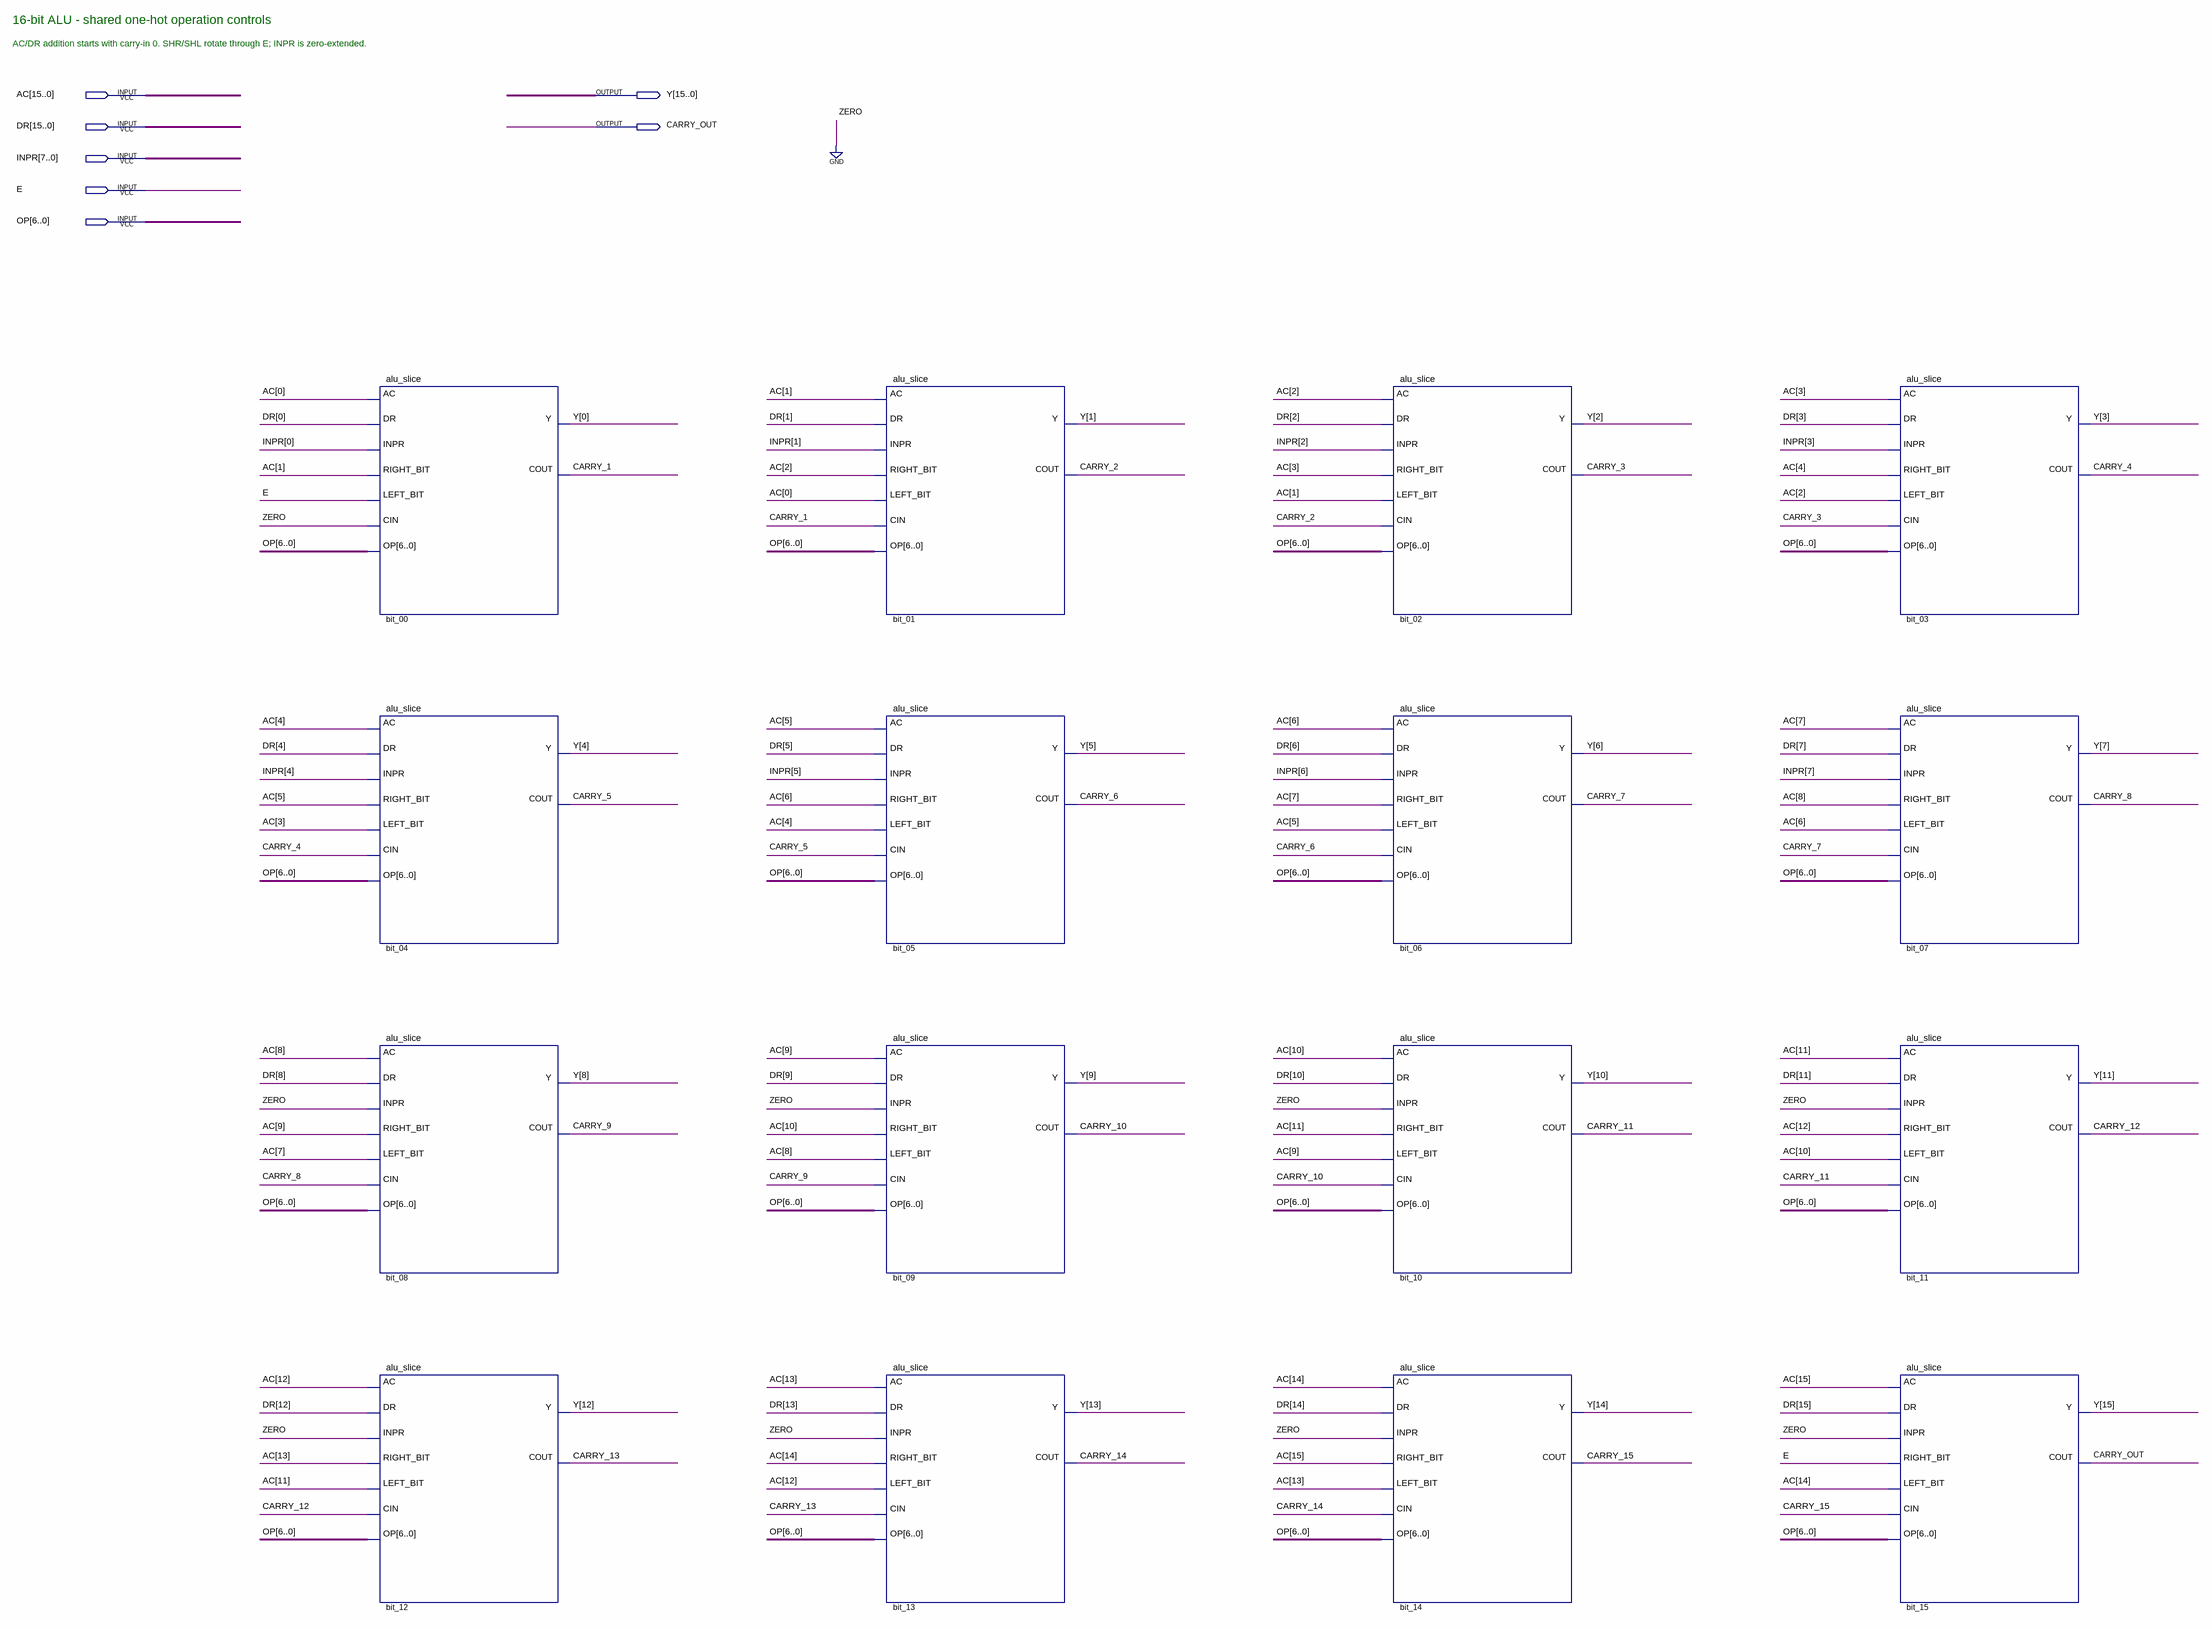
[diagram p0: schematic sheet]
// Quartus schematic alu16.bdf as structural Verilog: 16 symbols, 7 pins
module alu16 (
  input  [15:0] AC,
  input  [15:0] DR,
  input  [7:0] INPR,
  input  E,
  input  [6:0] OP,
  output [15:0] Y,
  output CARRY_OUT
);

  wire CARRY_1, CARRY_2, CARRY_3, CARRY_4, CARRY_5, CARRY_6, CARRY_7, CARRY_8, CARRY_9, CARRY_10, CARRY_11,
       CARRY_12, CARRY_13, CARRY_14, CARRY_15;

  alu_slice bit_00 (
    .AC(AC[0]), .DR(DR[0]), .INPR(INPR[0]), .RIGHT_BIT(AC[1]), .LEFT_BIT(E), .CIN(1'b0), .OP(OP), .Y(Y[0]),
    .COUT(CARRY_1));
  alu_slice bit_04 (
    .AC(AC[4]), .DR(DR[4]), .INPR(INPR[4]), .RIGHT_BIT(AC[5]), .LEFT_BIT(AC[3]), .CIN(CARRY_4), .OP(OP),
    .Y(Y[4]), .COUT(CARRY_5));
  alu_slice bit_08 (
    .AC(AC[8]), .DR(DR[8]), .INPR(1'b0), .RIGHT_BIT(AC[9]), .LEFT_BIT(AC[7]), .CIN(CARRY_8), .OP(OP),
    .Y(Y[8]), .COUT(CARRY_9));
  alu_slice bit_12 (
    .AC(AC[12]), .DR(DR[12]), .INPR(1'b0), .RIGHT_BIT(AC[13]), .LEFT_BIT(AC[11]), .CIN(CARRY_12), .OP(OP),
    .Y(Y[12]), .COUT(CARRY_13));
  alu_slice bit_01 (
    .AC(AC[1]), .DR(DR[1]), .INPR(INPR[1]), .RIGHT_BIT(AC[2]), .LEFT_BIT(AC[0]), .CIN(CARRY_1), .OP(OP),
    .Y(Y[1]), .COUT(CARRY_2));
  alu_slice bit_05 (
    .AC(AC[5]), .DR(DR[5]), .INPR(INPR[5]), .RIGHT_BIT(AC[6]), .LEFT_BIT(AC[4]), .CIN(CARRY_5), .OP(OP),
    .Y(Y[5]), .COUT(CARRY_6));
  alu_slice bit_09 (
    .AC(AC[9]), .DR(DR[9]), .INPR(1'b0), .RIGHT_BIT(AC[10]), .LEFT_BIT(AC[8]), .CIN(CARRY_9), .OP(OP),
    .Y(Y[9]), .COUT(CARRY_10));
  alu_slice bit_13 (
    .AC(AC[13]), .DR(DR[13]), .INPR(1'b0), .RIGHT_BIT(AC[14]), .LEFT_BIT(AC[12]), .CIN(CARRY_13), .OP(OP),
    .Y(Y[13]), .COUT(CARRY_14));
  alu_slice bit_02 (
    .AC(AC[2]), .DR(DR[2]), .INPR(INPR[2]), .RIGHT_BIT(AC[3]), .LEFT_BIT(AC[1]), .CIN(CARRY_2), .OP(OP),
    .Y(Y[2]), .COUT(CARRY_3));
  alu_slice bit_06 (
    .AC(AC[6]), .DR(DR[6]), .INPR(INPR[6]), .RIGHT_BIT(AC[7]), .LEFT_BIT(AC[5]), .CIN(CARRY_6), .OP(OP),
    .Y(Y[6]), .COUT(CARRY_7));
  alu_slice bit_10 (
    .AC(AC[10]), .DR(DR[10]), .INPR(1'b0), .RIGHT_BIT(AC[11]), .LEFT_BIT(AC[9]), .CIN(CARRY_10), .OP(OP),
    .Y(Y[10]), .COUT(CARRY_11));
  alu_slice bit_14 (
    .AC(AC[14]), .DR(DR[14]), .INPR(1'b0), .RIGHT_BIT(AC[15]), .LEFT_BIT(AC[13]), .CIN(CARRY_14), .OP(OP),
    .Y(Y[14]), .COUT(CARRY_15));
  alu_slice bit_03 (
    .AC(AC[3]), .DR(DR[3]), .INPR(INPR[3]), .RIGHT_BIT(AC[4]), .LEFT_BIT(AC[2]), .CIN(CARRY_3), .OP(OP),
    .Y(Y[3]), .COUT(CARRY_4));
  alu_slice bit_07 (
    .AC(AC[7]), .DR(DR[7]), .INPR(INPR[7]), .RIGHT_BIT(AC[8]), .LEFT_BIT(AC[6]), .CIN(CARRY_7), .OP(OP),
    .Y(Y[7]), .COUT(CARRY_8));
  alu_slice bit_11 (
    .AC(AC[11]), .DR(DR[11]), .INPR(1'b0), .RIGHT_BIT(AC[12]), .LEFT_BIT(AC[10]), .CIN(CARRY_11), .OP(OP),
    .Y(Y[11]), .COUT(CARRY_12));
  alu_slice bit_15 (
    .AC(AC[15]), .DR(DR[15]), .INPR(1'b0), .RIGHT_BIT(E), .LEFT_BIT(AC[14]), .CIN(CARRY_15), .OP(OP),
    .Y(Y[15]), .COUT(CARRY_OUT));

  // Notes on the sheet:
  //   16-bit ALU - shared one-hot operation controls
  //   AC/DR addition starts with carry-in 0. SHR/SHL rotate through E; INPR is zero-extended.
endmodule
